# Altium project Project Watchdog.PrjPcb
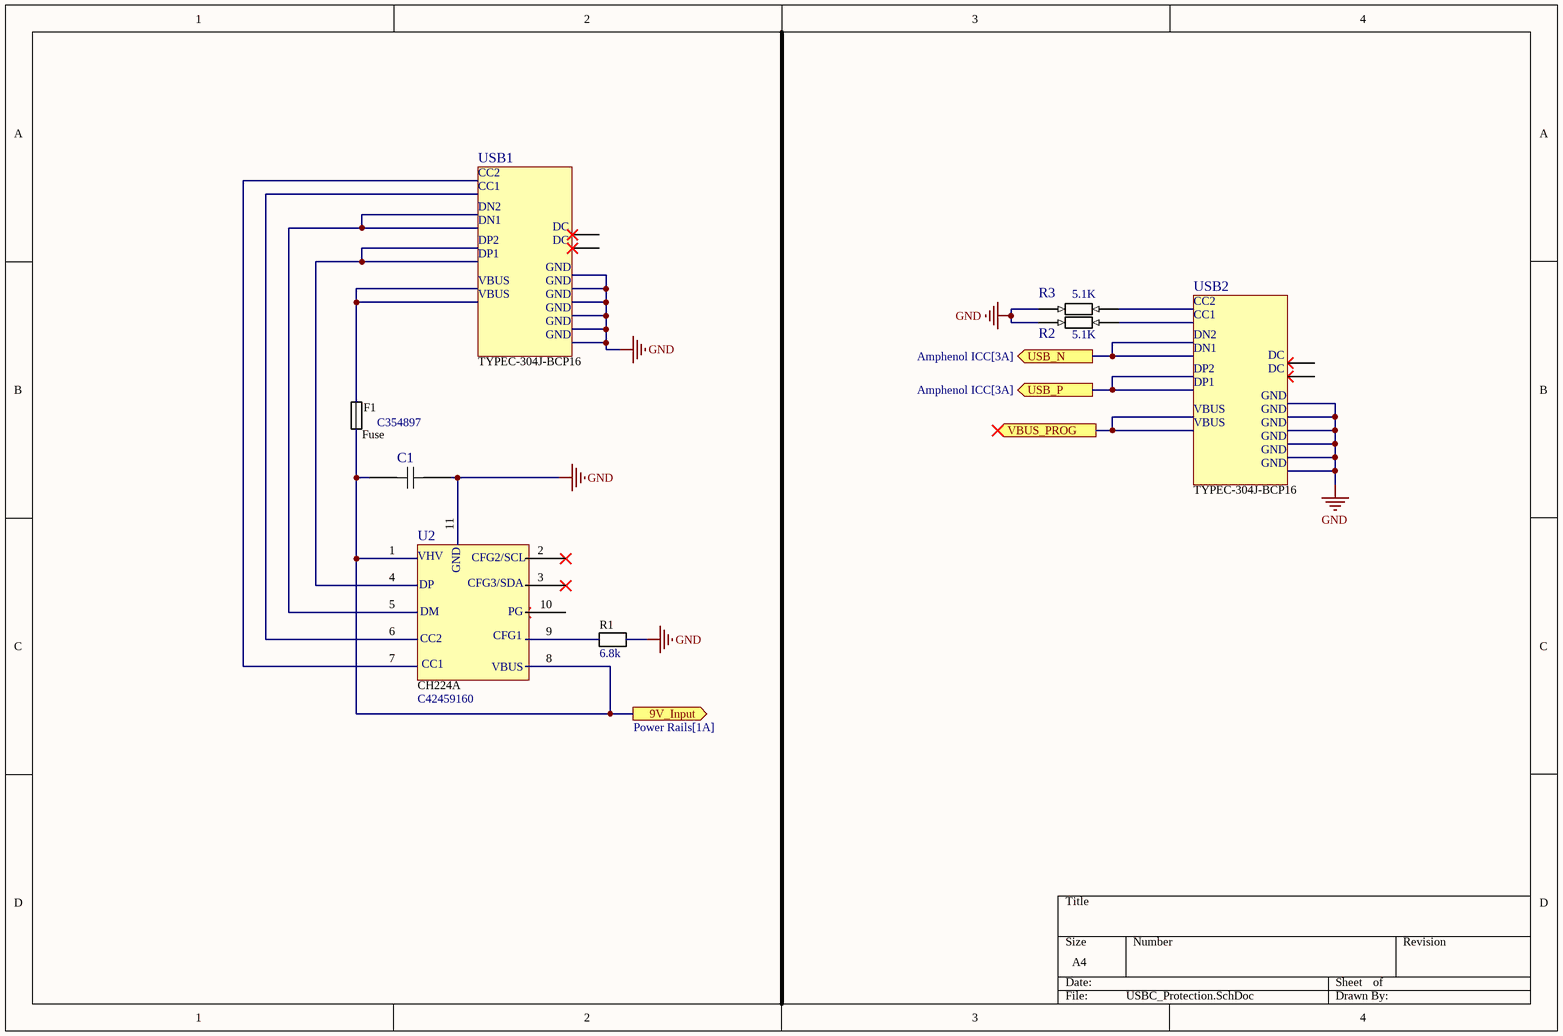
[diagram p0: USBC_Protection.SchDoc]
4 sheets, 43 parts. Net scope: flat (ports and power ports of the same name join across sheets).
Board file: Watchdog PCB.PcbDoc
Sheets:
  USBC_Protection.SchDoc
  Power Rails.SchDoc
  Amphenol ICC.SchDoc
  M.2 & CSI2.SchDoc

## Sheet USBC_Protection.SchDoc
size A4; SheetNumber: 1; SheetTotal: 4

### Parts
C1  CC0603KRX5R9BB105  [C0603]  (value not drawn)
F1  Fuse  Name: C354897  [F1206]
R1  value 6.8k  [R0603]  (hidden comment: CQ03WAJ0682T5E)
R2  value 5.1K  [R0603]  (hidden comment: 0603WAF5101T5E)
R3  value 5.1K  [R0603]  (hidden comment: 0603WAF5101T5E)
U2  CH224A  Name: C42459160  [ESSOP-10_L4.9-W3.9-P1.0-LS6.0-TL-EP]
USB1  TYPEC-304J-BCP16  [USB-C-SMD_TYPEC-304J-BCP16]
USB2  TYPEC-304J-BCP16  [USB-C-SMD_TYPEC-304J-BCP16]

### Ports
9V_Input (out, see Power Rails[1A]), USB_N (out, see Amphenol ICC[3A]), USB_P (out, see Amphenol ICC[3A]), VBUS_PROG (out)

### Nets
GND: C1.1 R1.2 R2.1 R3.1 U2.11 USB1.13(GND) USB1.14(GND) USB1.15(GND) USB1.16(GND) USB1.A1B12(GND) USB1.B1A12(GND) USB2.13(GND) USB2.14(GND) USB2.15(GND) USB2.16(GND) USB2.A1B12(GND) USB2.B1A12(GND)
USB_N: USB2.A7(DN1) USB2.B7(DN2) ; port USB_N
USB_P: USB2.A6(DP1) USB2.B6(DP2) ; port USB_P
NetC1_2: C1.2 F1.1 U2.1 U2.8 ; port 9V_Input
NetF1_2: F1.2 USB1.A4B9(VBUS) USB1.B4A9(VBUS)
NetR1_1: R1.1 U2.9
NetR2_2: R2.2 USB2.A5(CC1)
NetR3_2: R3.2 USB2.B5(CC2)
NetU2_4: U2.4 USB1.A6(DP1) USB1.B6(DP2)
NetU2_5: U2.5 USB1.A7(DN1) USB1.B7(DN2)
NetU2_6: U2.6 USB1.A5(CC1)
NetU2_7: U2.7 USB1.B5(CC2)
NetUSB2_A4B9: USB2.A4B9(VBUS) USB2.B4A9(VBUS) ; port VBUS_PROG

Not connected (* = marked no-connect by the designer): U2 2* 3* 10*; USB1 A8(SBU1)* B8(SBU2)*; USB2 A8(SBU1)* B8(SBU2)*

### Notes on the sheet
- (in symbol CH224A) VHV; CFG2/SCL; GND; DP; CFG3/SDA; DM; PG; CC2; CFG1; CC1; VBUS
- (in symbol TYPEC-304J-BCP16) DC

### Library data of the parts
C1 = CC0603KRX5R9BB105: 1uF ±10% 50V Ceramic Capacitor X5R 0603; Name: C128624; Value: 1uF; Source: JLCPCB
F1 = 1206T3A63V: 3A Fuse Surface Mount 1206; Source: JLCPCB
R1 = CQ03WAJ0682T5E: 6.8kÎ© Â±5% 100mW 0603 Thick Film Resistor AEC-Q200; Name: C2770993; Source: JLCPCB
R2 R3 = 0603WAF5101T5E: 5.1kÎ© Â±1% 100mW 0603 Thick Film Resistor; Name: C23186; Source: JLCPCB
U2 = CH224A: Power Receiver Controller 1C 140W ESSOP-10 Power Management - Specialized RoHS; Source: JLCPCB
USB1 USB2 = TYPEC-304J-BCP16: USB-C (USB TYPE-C) Receptacle Connector 16 Position Surface Mount, Right Angle; Name: C2835315; Source: JLCPCB

## Sheet Power Rails.SchDoc
size A4; SheetNumber: 2; SheetTotal: 4
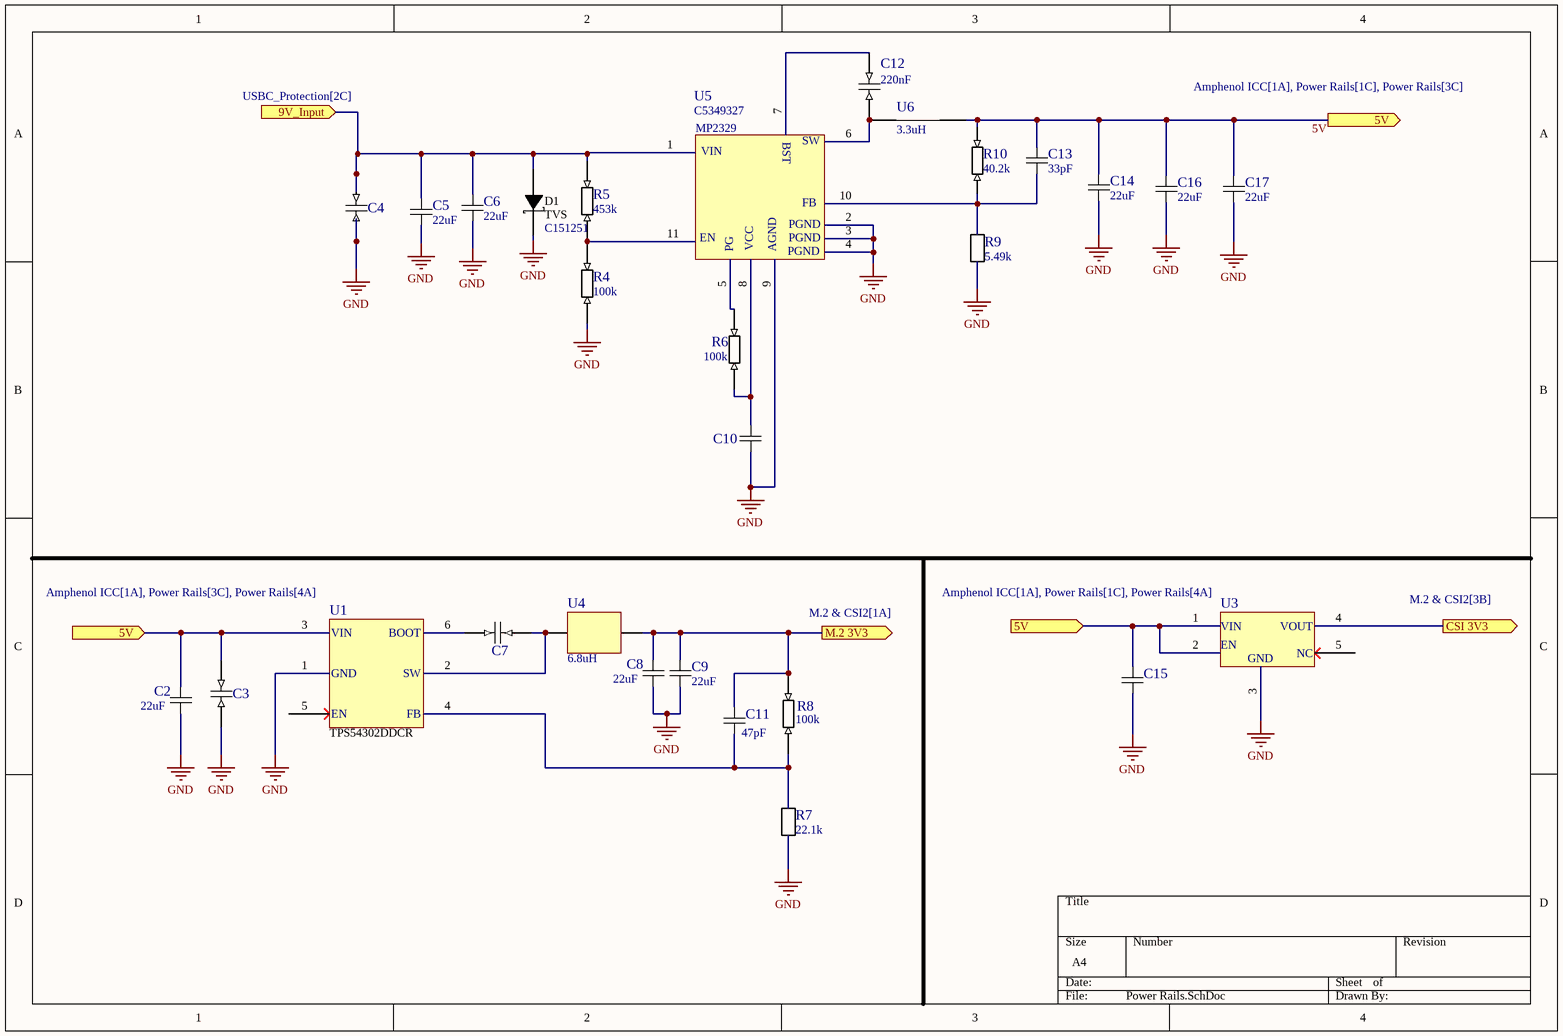
[diagram p1: Power Rails.SchDoc]

### Parts
C2  value 22uF  [C0805]  (hidden comment: CL21A226MAQNNNE)
C3  CL10B104JB8NNNC  [C0603]  (value not drawn)
C4  CL10B104JB8NNNC  [C0603]  (value not drawn)
C5  value 22uF  [C0805]  (hidden comment: CL21A226MAQNNNE)
C6  value 22uF  [C0805]  (hidden comment: CL21A226MAQNNNE)
C7  CL10B104JB8NNNC  [C0603]  (value not drawn)
C8  value 22uF  [C0805]  (hidden comment: CL21A226MAQNNNE)
C9  value 22uF  [C0805]  (hidden comment: CL21A226MAQNNNE)
C10  CC0603KRX5R9BB105  [C0603]  (value not drawn)
C11  value 47pF  [C0603]  (hidden comment: 0603CG470J500NT)
C12  value 220nF  [C0603]  (hidden comment: CL10B224KA8NNNC)
C13  value 33pF  [C0603]  (hidden comment: TCC0603COG330F500CT)
C14  value 22uF  [C0805]  (hidden comment: CL21A226MAQNNNE)
C15  CC0603KRX5R9BB105  [C0603]  (value not drawn)
C16  value 22uF  [C0805]  (hidden comment: CL21A226MAQNNNE)
C17  value 22uF  [C0805]  (hidden comment: CL21A226MAQNNNE)
D1  TVS  Name: C151251  [SMB_L4.6-W3.6-LS5.3-RD]
R4  value 100k  [R0603]  (hidden comment: 0603WAF1003T5E)
R5  value 453k  [R0603]  (hidden comment: 0603WAF4533T5E)
R6  value 100k  [R0603]  (hidden comment: 0603WAF1003T5E)
R7  value 22.1k  [R0603]  (hidden comment: RT0603BRD0722K1L)
R8  value 100k  [R0603]  (hidden comment: 0603WAF1003T5E)
R9  value 5.49k  [R0603]  (hidden comment: FRQ0603F5491TS)
R10  value 40.2k  [R0603]  (hidden comment: 0603WAF4022T5E)
U1  TPS54302DDCR  [SOT-23-6_L2.9-W1.6-P0.95-LS2.8-BL]
U3  AP2112K-3.3TRG1  [SOT-25-5_L2.9-W1.6-P0.95-LS2.8-BL]  (value not drawn)
U4  value 6.8uH  [IND-SMD_L5.7-W5.2]  (hidden comment: CXP0530-6R8M-AG(6.8uh))
U5  Name: C5349327  [QFN-11_L2.0-W2.0-P0.50_MP2384CGG-Z]  (hidden comment: MP2329GG-Z)
U6  value 3.3uH  [IND-SMD_L13.8-W12.8]  (hidden comment: CYA1250-3.3UH)

### Ports
5V (in, see Amphenol ICC[1A], Power Rails[1C], Power Rails[4A]), 5V (in, see Amphenol ICC[1A], Power Rails[3C], Power Rails[4A]), 5V (out, see Amphenol ICC[1A], Power Rails[1C], Power Rails[3C]), 9V_Input (in, see USBC_Protection[2C]), CSI 3V3 (out, see M.2 & CSI2[3B]), M.2 3V3 (out, see M.2 & CSI2[1A])

### Nets
GND: C2.2 C3.1 C4.1 C5.1 C6.1 C8.2 C9.2 C10.1 C14.2 C15.1 C16.2 C17.2 D1.1(K) R4.1 R7.1 R9.1 U1.1(GND) U3.3 U5.2 U5.3 U5.4 U5.9
5V: C2.1 C3.2 C13.2 C14.1 C15.2 C16.1 C17.1 R10.2 U1.3(VIN) U3.1(VIN) U3.2(EN) U6.2 ; port 5V
NetC1_2: C4.2 C5.2 C6.2 D1.2(A) R5.2 U5.1 ; port 9V_Input
NetC7_1: C7.1 U1.2(SW) U4.1
NetC7_2: C7.2 U1.6(BOOT)
NetC8_1: C8.1 C9.1 C11.2 R8.2 U4.2 ; port M.2 3V3
NetC10_2: C10.2 R6.1 U5.8
NetC11_1: C11.1 R7.2 R8.1 U1.4(FB)
NetC12_1: C12.1 U5.6 U6.1
NetC12_2: C12.2 U5.7
NetC13_1: C13.1 R9.2 R10.1 U5.10
NetCN4_22: U3.4 ; port CSI 3V3
NetR4_2: R4.2 R5.1 U5.11
NetR6_2: R6.2 U5.5

Not connected (* = marked no-connect by the designer): U1 5(EN)*; U3 5*

### Notes on the sheet
- (in symbol AP2112K-3.3TRG1) VOUT; NC; GND
- (in symbol MP2329GG-Z) MP2329; BST; SW; VIN; FB; PGND; EN; VCC; PG; AGND

### Library data of the parts
C2 C5 C6 C8 C9 C14 C16 C17 = CL21A226MAQNNNE: 22uF ±20% 25V Ceramic Capacitor X5R 0805; Name: C45783; Source: JLCPCB
C3 C4 C7 = CL10B104JB8NNNC: 100nF ±5% 50V Ceramic Capacitor X7R 0603; Name: C24452; Value: 100nF; Source: JLCPCB
C10 C15 = CC0603KRX5R9BB105: as C1 on sheet USBC_Protection; Value: 1uF; Source: JLCPCB
C11 = 0603CG470J500NT: 47pF ±5% 50V Ceramic Capacitor C0G 0603; Name: C94904; Source: JLCPCB
C12 = CL10B224KA8NNNC: 220nF ±10% 25V Ceramic Capacitor X7R 0603; Name: C21120; Source: JLCPCB
C13 = TCC0603COG330F500CT: 33pF C0G ±1% 50V 0603 Ceramic Capacitors; Name: C48543706; Source: JLCPCB
D1 = SMBJ12A_C151251: 21.5VC Clamp 28A@10/1000us Ipp TVS DIODE DO-214AA; Source: JLCPCB
R4 R6 R8 = 0603WAF1003T5E: 100kÎ© Â±1% 100mW 0603 Thick Film Resistor; Name: C25803; Source: JLCPCB
R5 = 0603WAF4533T5E: 453kÎ© Â±1% 100mW 0603 Thick Film Resistor; Name: C25818; Source: JLCPCB
R7 = RT0603BRD0722K1L: 22.1kÎ© 100mW 75V Thin Film Resistor Â±25ppm/â„ƒ Â±0.1% 0603 Chip Resistor - Surface Mount RoHS; Name: C723484; Source: JLCPCB
R9 = FRQ0603F5491TS: 5.49kÎ© 100mW 75V Thick Film Resistor Â±100ppm/â„ƒ Â±1% 0603 Chip Resistor - Surface Mount; Name: C54102278; Source: JLCPCB
R10 = 0603WAF4022T5E: 40.2kÎ© Â±1% 100mW 0603 Thick Film Resistor; Name: C12447; Source: JLCPCB
U1 = TPS54302DDCR_C311983: Buck Switching Regulator IC Adjustable 1 Output 3A TSOT-23-6; Name: C311983; Source: JLCPCB
U3 = AP2112K-3.3TRG1: 3.3V Positive Fixed SOT-25-5 Voltage Regulators - Linear, Low Drop Out (LDO) Regulators RoHS; Name: C51118; Source: JLCPCB
U4 = CXP0530-6R8M-AG_6.8UH: 3.5A 6.8uH Â±20% 5A 70mÎ© Molded inductor SMD,5.7x5.2mm Fixed Inductors; Name: C7461350; Source: JLCPCB
U6 = CYA1250-3.3UH: 20A 3.3uH ±20% 32A Molded inductor SMD,13.8x12.8mm Fixed Inductors; Name: C19268654; Source: JLCPCB
U5 = MP2329GG-Z: Source: JLCPCB

## Sheet Amphenol ICC.SchDoc
size A4; SheetNumber: 3; SheetTotal: 4
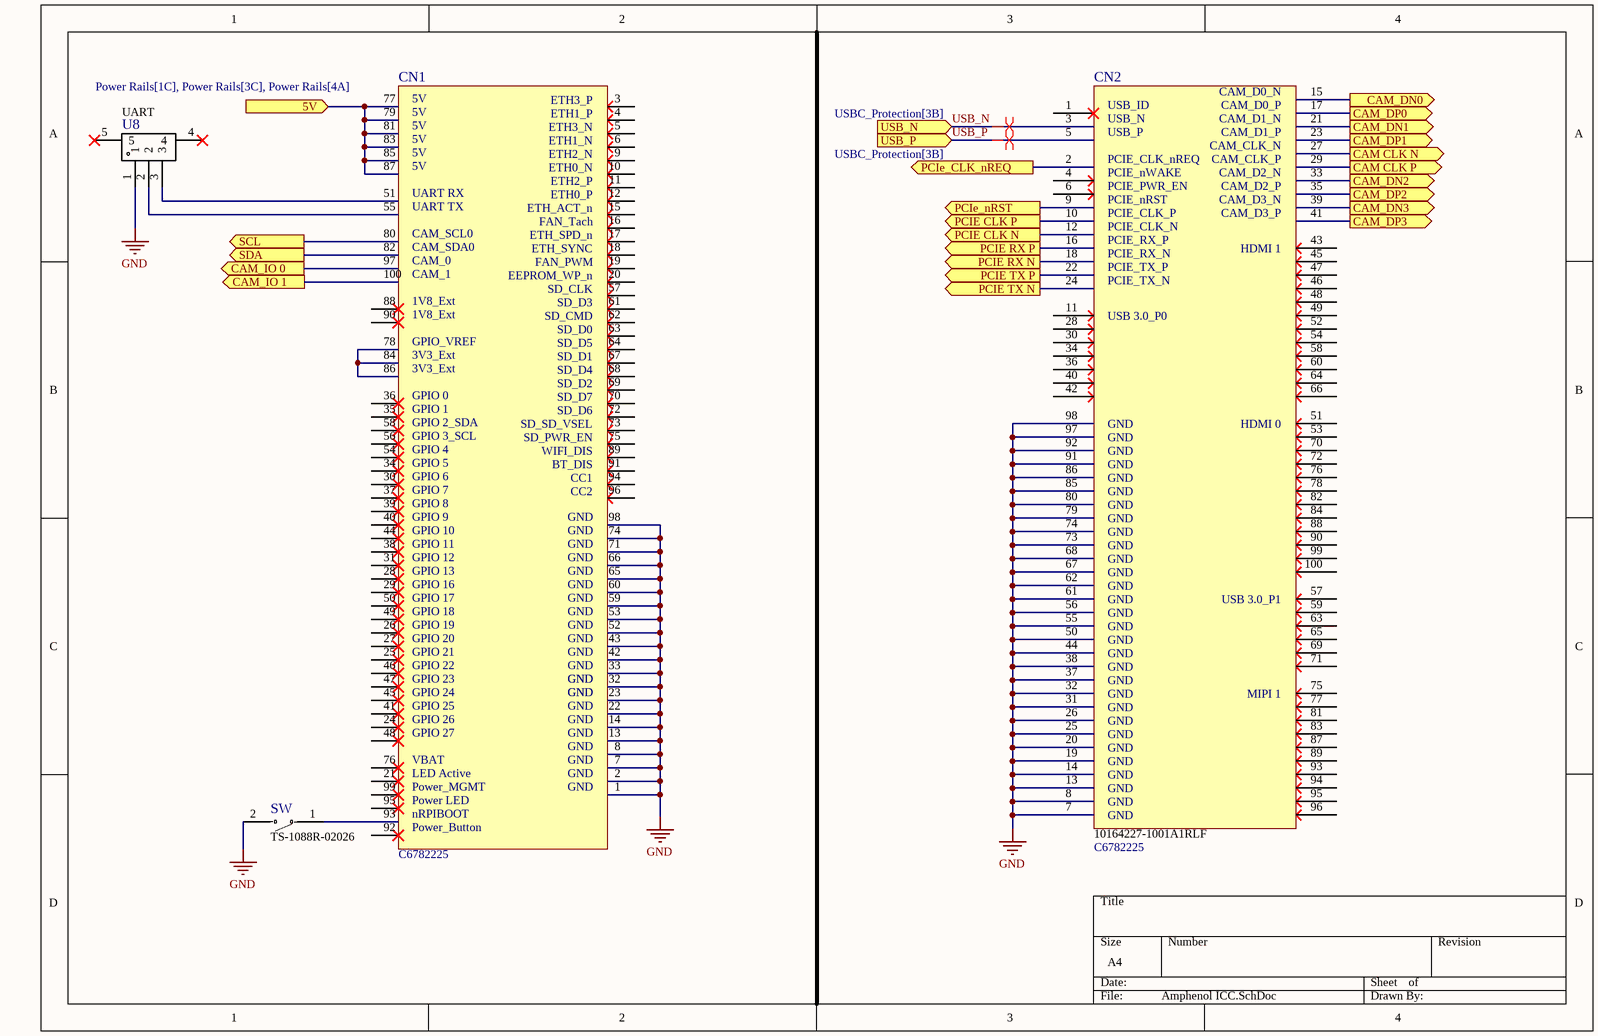
[diagram p2: Amphenol ICC.SchDoc]

### Parts
CN1  10164227-1001A1RLF  [CONN-SMD_100P-P0.40_10164227-1001A1RLF]  (value not drawn)
CN2  10164227-1001A1RLF  Name: C6782225  [CONN-SMD_100P-P0.40_10164227-1001A1RLF]
SW  TS-1088R-02026  [SW-SMD_L3.9-W3.0-P4.45]
U8  UART  [CONN-TH_SM03B-GHS-TB-LF-SN]

### Ports
5V (in, see Power Rails[1C], Power Rails[3C], Power Rails[4A]), CAM CLK N (out, see M.2 & CSI2[3B]), CAM CLK P (out, see M.2 & CSI2[3B]), CAM_DN0 (out, see M.2 & CSI2[3A]), CAM_DN1 (out, see M.2 & CSI2[3B]), CAM_DN2 (out, see M.2 & CSI2[3B]), CAM_DN3 (out, see M.2 & CSI2[3B]), CAM_DP0 (out, see M.2 & CSI2[3B]), CAM_DP1 (out, see M.2 & CSI2[3B]), CAM_DP2 (out, see M.2 & CSI2[3B]), CAM_DP3 (out, see M.2 & CSI2[3B]), CAM_IO 0 (out, see M.2 & CSI2[3B]), CAM_IO 1 (out, see M.2 & CSI2[3B]), PCIE CLK N (out, see M.2 & CSI2[1B]), PCIE CLK P (out, see M.2 & CSI2[1B]), PCIE RX N (out, see M.2 & CSI2[1B]), PCIE RX P (out, see M.2 & CSI2[1B]), PCIE TX N (out, see M.2 & CSI2[1B]), PCIE TX P (out, see M.2 & CSI2[1B]), PCIe_CLK_nREQ (out, see M.2 & CSI2[1C]), PCIe_nRST (out, see M.2 & CSI2[1C]), SCL (out, see M.2 & CSI2[3B]), SDA (out, see M.2 & CSI2[3B]), USB_N (in, see USBC_Protection[3B]), USB_P (in, see USBC_Protection[3B])

### Nets
GND: CN1.1 CN1.2 CN1.7 CN1.8 CN1.13 CN1.14 CN1.22 CN1.23 CN1.32 CN1.33 CN1.42 CN1.43 CN1.52 CN1.53 CN1.59 CN1.60 CN1.65 CN1.66 CN1.71 CN1.74 CN1.98 CN2.7(GND) CN2.8(GND) CN2.13(GND) CN2.14(GND) CN2.19(GND) CN2.20(GND) CN2.25(GND) CN2.26(GND) CN2.31(GND) CN2.32(GND) CN2.37(GND) CN2.38(GND) CN2.44(GND) CN2.50(GND) CN2.55(GND) CN2.56(GND) CN2.61(GND) CN2.62(GND) CN2.67(GND) CN2.68(GND) CN2.73(GND) CN2.74(GND) CN2.79(GND) CN2.80(GND) CN2.85(GND) CN2.86(GND) CN2.91(GND) CN2.92(GND) CN2.97(GND) CN2.98(GND) SW.2 U8.1
5V: CN1.77 CN1.79 CN1.81 CN1.83 CN1.85 CN1.87 ; port 5V
CAM_CLK_N: CN2.27(MIPI_C_N) ; port CAM CLK N
CAM_CLK_P: CN2.29(MIPI_C_P) ; port CAM CLK P
CAM_D0_N: CN2.15(MIPI_D0_N) ; port CAM_DN0
CAM_D0_P: CN2.17(MIPI_D0_P) ; port CAM_DP0
CAM_D1_N: CN2.21(MIPI_D1_N) ; port CAM_DN1
CAM_D1_P: CN2.23(MIPI_D1_P) ; port CAM_DP1
CAM_D2_N: CN2.33(MIPI_D2_N) ; port CAM_DN2
CAM_D2_P: CN2.35(MIPI_D2_P) ; port CAM_DP2
CAM_D3_N: CN2.39(MIPI_D3_N) ; port CAM_DN3
CAM_D3_P: CN2.41(MIPI_D3_P) ; port CAM_DP3
PCIE_CLK_N: CN2.12(PCIe_CLK_N) ; port PCIE CLK N
PCIE_CLK_P: CN2.10(PCIe_CLK_P) ; port PCIE CLK P
PCIE_RX_N: CN2.18(PCIe_RX_N) ; port PCIE RX N
PCIE_RX_P: CN2.16(PCIe_RX_P) ; port PCIE RX P
PCIE_TX_N: CN2.24(PCIe_TX_N) ; port PCIE TX N
PCIE_TX_P: CN2.22(PCIe_TX_P) ; port PCIE TX P
USB_N: CN2.3(USB_N) ; port USB_N
USB_P: CN2.5(USB_P) ; port USB_P
NetCN1_51: CN1.51 U8.3
NetCN1_55: CN1.55 U8.2
NetCN1_78: CN1.78(GPIO_VREF) CN1.84 CN1.86
NetCN1_80: CN1.80 ; port SCL
NetCN1_82: CN1.82 ; port SDA
NetCN1_93: CN1.93 SW.1
NetCN1_97: CN1.97 ; port CAM_IO 0
NetCN1_100: CN1.100 ; port CAM_IO 1
NetCN2_2: CN2.2(PCIe_CLK_REQ) ; port PCIe_CLK_nREQ
NetCN2_9: CN2.9(PCIE_RST) ; port PCIe_nRST

Not connected (* = marked no-connect by the designer): CN1 3* 4* 5* 6* 9* 10* 11* 12* 15* 16* 17* 18* 19* 20* 21* 24* 25* 26* 27* 28* 29* 30* 31* 34* 35* 36* 37* 38* 39* 40* 41* 44* 45* 46* 47* 48* 49* 50* 54* 56* 57* 58* 61* 62* 63* 64* 67* 68* 69* 70* 72* 73* 75* 76* 88* 89* 90* 91* 92* 94* 95* 96* 99*; CN2 1(USB_ID)* 4(PCIe_WAKE)* 6(PCIE_PWR_EN)* 11(111)* 28(128)* 30(130)* 34(134)* 36(136)* 40(140)* 42(142)* 43(143)* 45(145)* 46(146)* 47(147)* 48(148)* 49(149)* 51(151)* 52(152)* 53(153)* 54(154)* 57(157)* 58(158)* 59(159)* 60(160)* 63(163)* 64(164)* 65(165)* 66(166)* 69(169)* 70(170)* 71(171)* 72(172)* 75(175)* 76(176)* 77(177)* 78(178)* 81(181)* 82(182)* 83(183)* 84(184)* 87(187)* 88(188)* 89(189)* 90(190)* 93(193)* 94(194)* 95(195)* 96(196)* 99(199)* 100(200)*; U8 4* 5*

### Layout directives
differential pair: USB_N, USB_P

### Notes on the sheet
- (in symbol 10164227-1001A1RLF) ETH3_P; 5V; ETH1_P; ETH3_N; ETH1_N; ETH2_N; ETH0_N; ETH2_P; ETH0_P; UART RX; ETH_ACT_n; UART TX; FAN_Tach; ETH_SPD_n; CAM_SCL0; ETH_SYNC; CAM_SDA0; FAN_PWM; CAM_0; EEPROM_WP_n; CAM_1; SD_CLK; SD_D3; 1V8_Ext; SD_CMD; SD_D0; SD_D5; SD_D1; 3V3_Ext; SD_D4; SD_D2; SD_D7; GPIO 0; SD_D6; GPIO 1; SD_SD_VSEL; GPIO 2_SDA; SD_PWR_EN; GPIO 3_SCL; WIFI_DIS; GPIO 4; BT_DIS; GPIO 5; CC1; GPIO 6; CC2; GPIO 7; GPIO 8; GPIO 9; GND; GPIO 10; GPIO 11; GPIO 12; GPIO 13; GPIO 16; GPIO 17; GPIO 18; GPIO 19; GPIO 20; GPIO 21; GPIO 22; GPIO 23; GPIO 24; GPIO 25; GPIO 26; GPIO 27; VBAT; LED Active; Power_MGMT; Power LED; nRPIBOOT; Power_Button; CAM_D0_N; CAM_D0_P; CAM_D1_N; CAM_D1_P; CAM_CLK_N; PCIE_CLK_nREQ; CAM_CLK_P; PCIE_nWAKE; CAM_D2_N; CAM_D2_P; PCIE_nRST; CAM_D3_N; PCIE_CLK_P; CAM_D3_P; PCIE_CLK_N; PCIE_RX_P; HDMI 1; PCIE_RX_N; PCIE_TX_P; PCIE_TX_N; USB 3.0_P0; HDMI 0; USB 3.0_P1; MIPI 1

### Library data of the parts
CN1 = 10164227-1001A1RLF: 100 Position Board to Board Connector Surface Mount,P=0.4mm Gold; Name: C6782225; Source: JLCPCB
CN2 = 10164227-1001A1RLF: 100 Position Board to Board Connector Surface Mount,P=0.4mm Gold; Source: JLCPCB
SW = TS-1088R-02026: Tactile Switch SPST 2mm 3.9mm x 2.93mm Surface Mount; Name: C455280; Source: JLCPCB
U8 = SM03B-GHS-TB_LF_SN: Connector Header 3 position 1.25mm Pitch 1A Surface Mount, Right Angle -25â„ƒ~+85â„ƒ; Name: C514175; Source: JLCPCB

## Sheet M.2 & CSI2.SchDoc
size A4; SheetNumber: 4; SheetTotal: 4
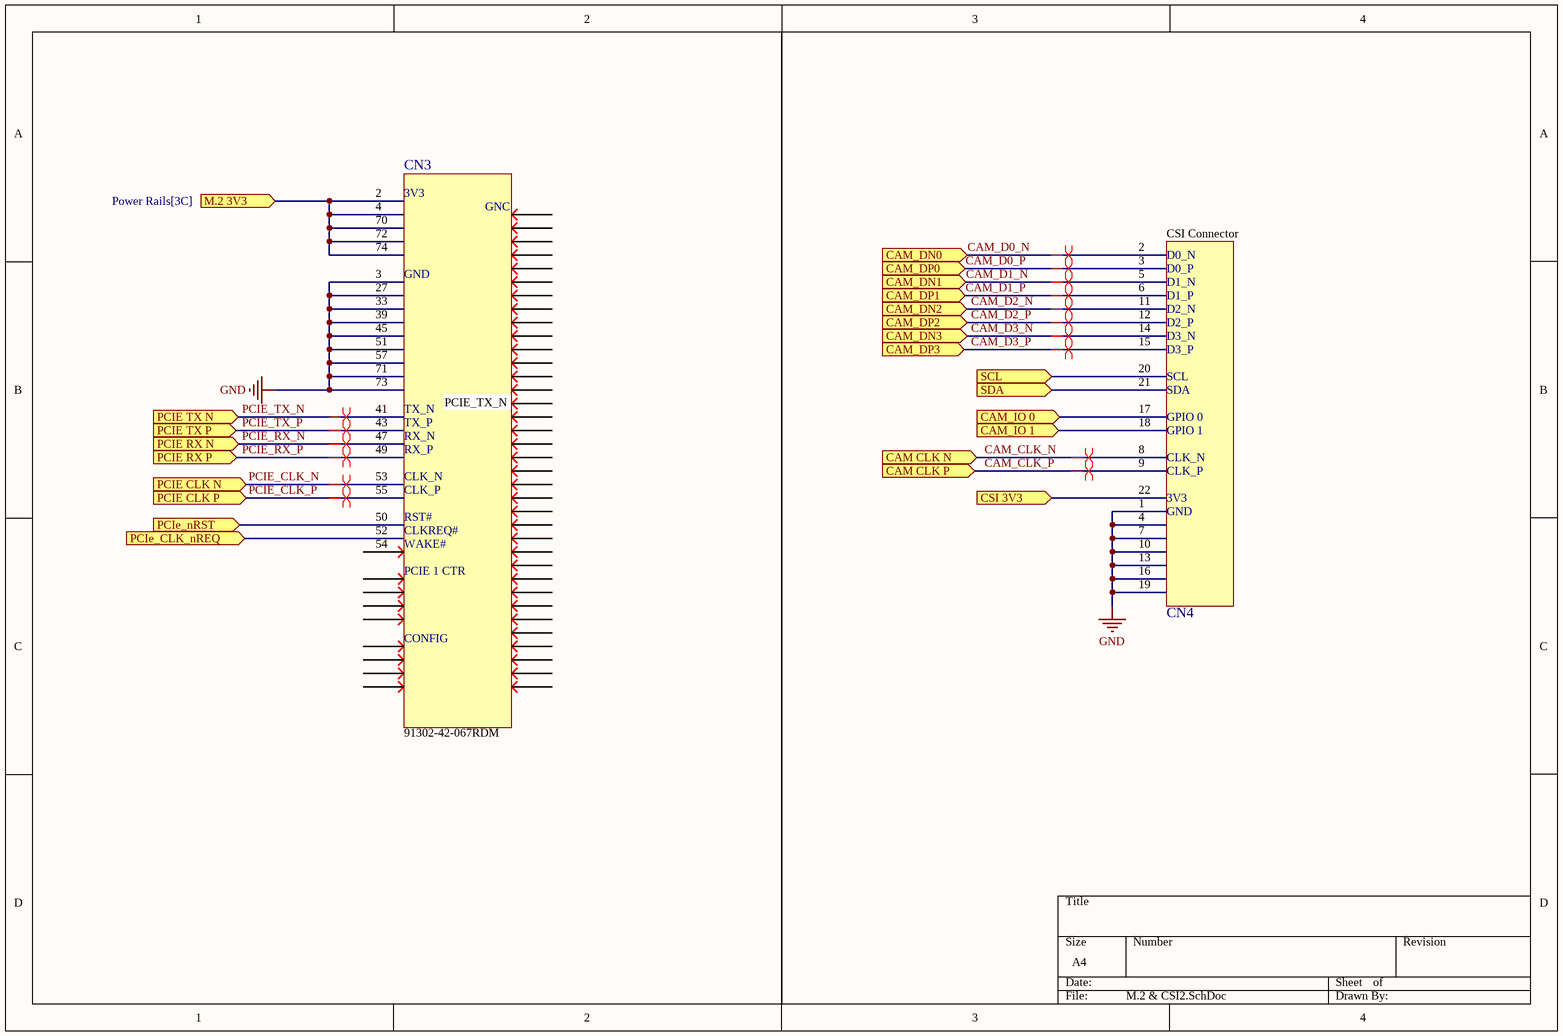
[diagram p3: M.2 & CSI2.SchDoc]

### Parts
CN3  91302-42-067RDM  [CONN-SMD_91302-32-067RDM]
CN4  CSI Connector  [FPC-SMD_22P-P0.50_FH55-22S-0.5SH]

### Ports
CAM CLK N (in, see Amphenol ICC[4A]), CAM CLK P (in, see Amphenol ICC[4A]), CAM_DN0 (in, see Amphenol ICC[4A]), CAM_DN1 (in, see Amphenol ICC[4A]), CAM_DN2 (in, see Amphenol ICC[4A]), CAM_DN3 (in, see Amphenol ICC[4A]), CAM_DP0 (in, see Amphenol ICC[4A]), CAM_DP1 (in, see Amphenol ICC[4A]), CAM_DP2 (in, see Amphenol ICC[4A]), CAM_DP3 (in, see Amphenol ICC[4A]), CAM_IO 0 (in, see Amphenol ICC[1B]), CAM_IO 1 (in, see Amphenol ICC[1B]), CSI 3V3 (in, see Power Rails[4C]), M.2 3V3 (in, see Power Rails[3C]), PCIE CLK N (in, see Amphenol ICC[3A]), PCIE CLK P (in, see Amphenol ICC[3A]), PCIE RX N (in, see Amphenol ICC[3B]), PCIE RX P (in, see Amphenol ICC[3A]), PCIE TX N (in, see Amphenol ICC[3B]), PCIE TX P (in, see Amphenol ICC[3B]), PCIe_CLK_nREQ (in, see Amphenol ICC[3A]), PCIe_nRST (in, see Amphenol ICC[3A]), SCL (in, see Amphenol ICC[1A]), SDA (in, see Amphenol ICC[1A])

### Nets
GND: CN3.3 CN3.27 CN3.33 CN3.39 CN3.45 CN3.51 CN3.57 CN3.71 CN3.73 CN4.1(GND) CN4.4(GND) CN4.7(GND) CN4.10(GND) CN4.13(GND) CN4.16(GND) CN4.19(GND)
CAM_CLK_N: CN4.8(CLK_N) ; port CAM CLK N
CAM_CLK_P: CN4.9(CLK_P) ; port CAM CLK P
CAM_D0_N: CN4.2(DATA_0_N) ; port CAM_DN0
CAM_D0_P: CN4.3(DATA_0_P) ; port CAM_DP0
CAM_D1_N: CN4.5(DATA_1_N) ; port CAM_DN1
CAM_D1_P: CN4.6(DATA_1_P) ; port CAM_DP1
CAM_D2_N: CN4.11(DATA_2_N) ; port CAM_DN2
CAM_D2_P: CN4.12(DATA_2_P) ; port CAM_DP2
CAM_D3_N: CN4.14(DATA_3_N) ; port CAM_DN3
CAM_D3_P: CN4.15(DATA_3_P) ; port CAM_DP3
PCIE_CLK_N: CN3.53 ; port PCIE CLK N
PCIE_CLK_P: CN3.55 ; port PCIE CLK P
PCIE_RX_N: CN3.47 ; port PCIE RX N
PCIE_RX_P: CN3.49 ; port PCIE RX P
PCIE_TX_N: CN3.41 ; port PCIE TX N
PCIE_TX_P: CN3.43 ; port PCIE TX P
NetC8_1: CN3.2 CN3.4 CN3.70 CN3.72 CN3.74 ; port M.2 3V3
NetCN1_80: CN4.20(SCL) ; port SCL
NetCN1_82: CN4.21(SDA) ; port SDA
NetCN1_97: CN4.17(GPIO_0) ; port CAM_IO 0
NetCN1_100: CN4.18(GPIO_1) ; port CAM_IO 1
NetCN2_2: CN3.52 ; port PCIe_CLK_nREQ
NetCN2_9: CN3.50 ; port PCIe_nRST
NetCN4_22: CN4.22(PWR) ; port CSI 3V3

Not connected (* = marked no-connect by the designer): CN3 1* 5* 6* 7* 8* 9* 10* 11* 12* 13* 14* 15* 16* 17* 18* 19* 20* 21* 22* 23* 24* 25* 26* 28* 29* 30* 31* 32* 34* 35* 36* 37* 38* 40* 42* 44* 46* 48* 54* 56* 58* 67* 68* 69* 75*

### Layout directives
differential pair: CAM_CLK_N, CAM_CLK_P, CAM_D0_N, CAM_D0_P, CAM_D1_N, CAM_D1_P, CAM_D2_N, CAM_D2_P, CAM_D3_N, CAM_D3_P, PCIE_CLK_N, PCIE_CLK_P, PCIE_RX_N, PCIE_RX_P, PCIE_TX_N, PCIE_TX_P

### Notes on the sheet
- (near CN3) PCIE_TX_N
- (in symbol 91302-42-067RDM) 3V3; GNC; GND; TX_N; TX_P; RX_N; RX_P; CLK_N; CLK_P; RST#; CLKREQ#; WAKE#; PCIE 1 CTR; CONFIG
- (in symbol FH55-22S-0.5SH) D0_N; D0_P; D1_N; D1_P; D2_N; D2_P; D3_N; D3_P; 3V3

### Library data of the parts
CN3 = 91302-42-067RDM: 67P Surface Mount, Right Angle SMD,P=0.5mm Centronics Connectors RoHS; Name: C601195; Source: LCSC
CN4 = FH55-22S-0.5SH: Flip-Top -55â„ƒ~+85â„ƒ 22P 0.5mm 500mA 50V Gold Surface Mount, Right Angle Phosphor bronze SMD,P=0.5mm FFC, FPC (Flat Flexible) Connector Assemblies RoHS; Name: C5182313; Source: LCSC

## Nets that join several sheets
GND: USBC_Protection (17 pins), Power Rails (22 pins), Amphenol ICC (53 pins), M.2 & CSI2 (16 pins)
5V: Power Rails (12 pins), Amphenol ICC (6 pins)
CAM_CLK_N: Amphenol ICC (CN2.27), M.2 & CSI2 (CN4.8)
CAM_CLK_P: Amphenol ICC (CN2.29), M.2 & CSI2 (CN4.9)
CAM_D0_N: Amphenol ICC (CN2.15), M.2 & CSI2 (CN4.2)
CAM_D0_P: Amphenol ICC (CN2.17), M.2 & CSI2 (CN4.3)
CAM_D1_N: Amphenol ICC (CN2.21), M.2 & CSI2 (CN4.5)
CAM_D1_P: Amphenol ICC (CN2.23), M.2 & CSI2 (CN4.6)
CAM_D2_N: Amphenol ICC (CN2.33), M.2 & CSI2 (CN4.11)
CAM_D2_P: Amphenol ICC (CN2.35), M.2 & CSI2 (CN4.12)
CAM_D3_N: Amphenol ICC (CN2.39), M.2 & CSI2 (CN4.14)
CAM_D3_P: Amphenol ICC (CN2.41), M.2 & CSI2 (CN4.15)
NetC1_2: USBC_Protection (C1.2 F1.1 U2.1 U2.8), Power Rails (6 pins)
NetC8_1: Power Rails (5 pins), M.2 & CSI2 (5 pins)
NetCN1_80: Amphenol ICC (CN1.80), M.2 & CSI2 (CN4.20)
NetCN1_82: Amphenol ICC (CN1.82), M.2 & CSI2 (CN4.21)
NetCN1_97: Amphenol ICC (CN1.97), M.2 & CSI2 (CN4.17)
NetCN1_100: Amphenol ICC (CN1.100), M.2 & CSI2 (CN4.18)
NetCN2_2: Amphenol ICC (CN2.2), M.2 & CSI2 (CN3.52)
NetCN2_9: Amphenol ICC (CN2.9), M.2 & CSI2 (CN3.50)
NetCN4_22: Power Rails (U3.4), M.2 & CSI2 (CN4.22)
PCIE_CLK_N: Amphenol ICC (CN2.12), M.2 & CSI2 (CN3.53)
PCIE_CLK_P: Amphenol ICC (CN2.10), M.2 & CSI2 (CN3.55)
PCIE_RX_N: Amphenol ICC (CN2.18), M.2 & CSI2 (CN3.47)
PCIE_RX_P: Amphenol ICC (CN2.16), M.2 & CSI2 (CN3.49)
PCIE_TX_N: Amphenol ICC (CN2.24), M.2 & CSI2 (CN3.41)
PCIE_TX_P: Amphenol ICC (CN2.22), M.2 & CSI2 (CN3.43)
USB_N: USBC_Protection (USB2.A7 USB2.B7), Amphenol ICC (CN2.3)
USB_P: USBC_Protection (USB2.A6 USB2.B6), Amphenol ICC (CN2.5)